# EasyEDA Pro project ProPrj_SensUs2026_ParisBioTek_PCBs.epro, board PCB14
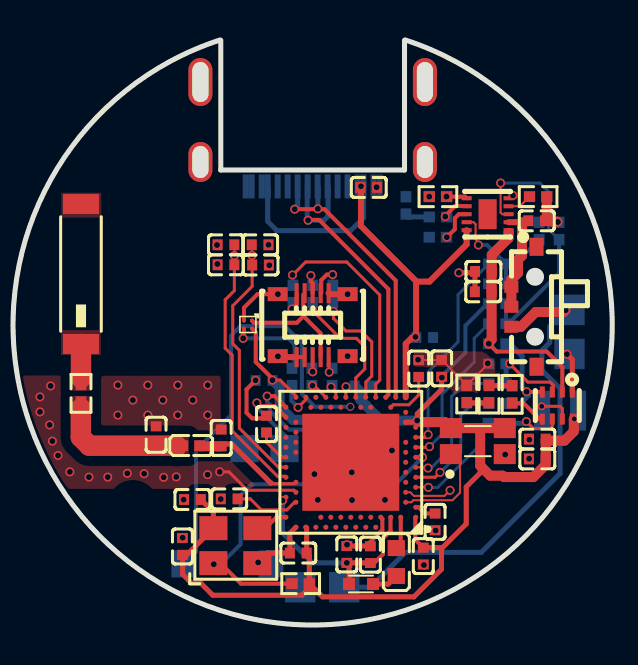
[diagram p2: board, top side]
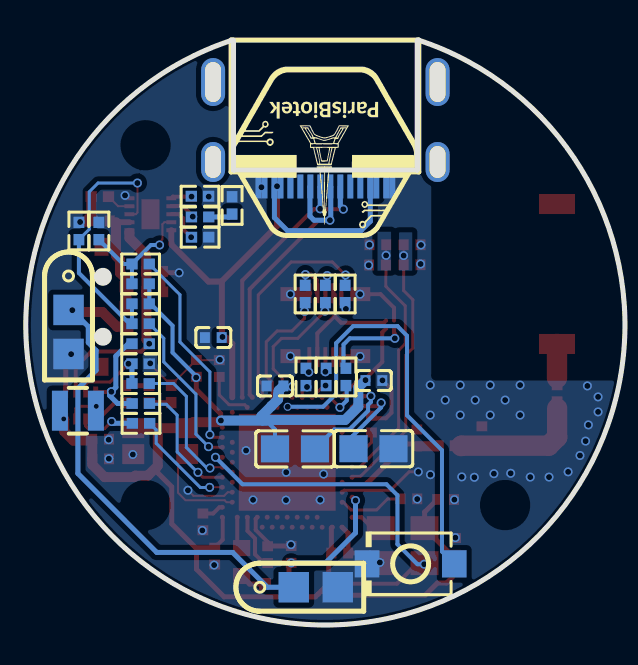
[diagram p3: board, bottom side, seen from below]

Outline 16.22 x 29.27 mm; copper layers: Top Layer, Bottom Layer. Coordinates in mm from the lower left corner of the outline.
Outline path: 9.27,29.27 arc(4.64,0) 0,29.27
Stack: Top Layer 0.035mm / Dielectric1 1.51mm FR4 er 4.5 / Bottom Layer 0.035mm

## Design rules (mm)
template: Custom Config
spacing copperThickness1oz (default): track to track 0.1, other pairs 0.1 to 0.3
spacing copperThickness2oz: track to track 0.203, other pairs 0.152 to 0.3
track width copperThickness1oz (default): min 0.09, default 0.254, max 2.54
track width copperThickness2oz: min 0.203, default 0.254, max 2.54
differential pair differentialPair (default): width min 0.127, default 0.254, max 2.54; gap min 0.152, default 0.152
via viaSize (default): diameter min 0.2, default 0.4, max 10; hole min 0.1, default 0.25, max 6.3
pour e2495 uses copper_imp

## Placement (name value [footprint] x y rotation side)
C1  4.7uF  [C0402]  9.95 12.83 90 top
C2  4.7uF  [C0402]  10.25 14.38 0 bottom
C3  4.7uF  [C0402]  11.1 12.84 90 top
C5  100nF  [C0402]  10.77 5.16 270 top
C8  1nF  [C0402]  2.33 10.05 90 top
C9  100pF  [C0402]  0.46 6.31 180 top
C10  1uF  [C0402]  6.35 3.53 270 top
C11  100nF  [C0402]  7.53 3.52 90 top
C12  100nF  [C0402]  -1.88 3.93 270 top
C13  4.7uF  [C0402]  -1.38 6.28 0 top
C14  100pF  [C0402]  2.01 19.02 0 top
C15  22pF  [C0402]  2.03 18.01 0 top
C16  100pF  [C0402]  0.3 19.02 180 top
C17  22pF  [C0402]  0.3 18.02 180 top
C24  4.7uF  [C0402]  13.19 17.69 0 top
C25  4.7uF  [C0402]  15.89 9.3 0 top
C26  4.7uF  [C0402]  15.89 8.31 0 top
C27  1uF  [C0402]  13.18 16.67 180 top
C28  1uF  [C0402]  15.86 20.22 0 top
C29  1uF  [C0402]  10.18 3.45 270 top
C30  100nF  [C0402]  7.16 11.96 0 bottom
C31  100nF  [C0402]  3.92 3.6 180 top
C32  100nF  [C0402]  2.21 12.23 180 bottom
C33  1uF  [C0402]  7.45 21.89 0 top
C37  0.5pF  [C0402]  -3.2 9.52 90 top
C38  0.8pF  [C0402]  0.06 9.36 270 top
C39  10uF  [C0805]  6.16 8.81 180 bottom
C40  10uF  [C0805]  2.23 8.82 0 bottom
CN1  513389873  [CONN-SMD_513389873]  4.64 15 0 top
L1  10uH  [L0603]  8.83 3.15 90 top
L2  15nH  [IND-SMD_L1.2-W0.6]  7.06 2.05 0 top
L4  2.2uH  [IND-SMD_L2.0-W1.6_MHCHL201610A-1R0M-Q8A]  17.03 10.72 0 bottom
L6  4.7nH  [L0402]  -1.44 8.97 180 top
OSC1  32MHz  [OSC-SMD_4P-L3.2-W2.5-BL]  0.77 3.97 0 top
R1  200kΩ  [R0402]  4.04 2.07 180 top
R2  200kΩ  [R0402]  14.63 11.54 90 top
R3  33kΩ  [R0402]  13.47 11.55 270 top
R4  33kΩ  [R0402]  12.35 11.56 90 top
R7  51kΩ  [R0402]  10.91 20.41 180 bottom
R8  5.1kΩ  [R0402]  9.31 20.99 90 bottom
R9  510Ω  [R0402]  10.91 19.4 180 bottom
R10  10kΩ  [R0402]  10.91 21.43 180 top
R11  0Ω  [R0402]  -6.97 11.59 90 top
R13  0Ω  [R0402]  15.98 19.71 270 bottom
R14  0Ω  [R0402]  16.98 19.71 270 bottom
R15  0Ω  [R0402]  4.6 12.41 90 bottom
R16  0Ω  [R0402]  5.61 12.41 90 bottom
R17  0Ω  [R0402]  5.65 16.56 90 bottom
R18  0Ω  [R0402]  4.64 16.56 90 bottom
R19  0Ω  [R0402]  3.65 16.56 270 bottom
R20  0Ω  [R0402]  3.61 12.41 90 bottom
R21  10kΩ  [R0402]  10.91 21.45 180 bottom
R27  200kΩ  [R0402]  13.89 14.07 0 bottom
R28  200kΩ  [R0402]  15.93 21.43 0 top
R29  200kΩ  [R0402]  13.89 13.07 180 bottom
R30  200kΩ  [R0402]  13.89 17.07 0 bottom
R31  200kΩ  [R0402]  13.89 16.07 0 bottom
R32  0Ω  [R0402]  13.89 12.08 0 bottom
R33  0Ω  [R0402]  13.87 10.09 0 bottom
R34  0Ω  [R0402]  13.89 18.06 0 bottom
R35  0Ω  [R0402]  13.89 15.07 0 bottom
R36  0Ω  [R0402]  13.88 11.08 0 bottom
SW2  TS-1088-AR02016  [SW-SMD_L3.9-W3.0-P4.45]  0.37 3.06 0 bottom
SW3  MK-11C04-G013  [SW-SMD_MK-11C04-G013]  15.22 15.92 90 top
U1  BQ25185DLHR  [WSON-10_L2.2-W2.0-P0.40-BL-EP_TI_DLH0010A]  13.4 20.55 90 top
U5  32.768kHz  [OSC-SMD_4P-L3.2-W1.5-BL]  12.91 9.2 0 top
U7  TPS22916BYFPR  [DSBGA-4_L0.8-W0.8-R2-C2-P0.40-BL]  1.4 15.03 180 top
U9  TPS62840DLCR  [VSON-8_L2.0-W1.5-P0.50-BL]  16.89 10.98 180 top
U10  -  [CSSMR950SH_CONN]  17.5 12.46 180 bottom
U11  2450AT43A100E  [ANT-SMD_L7.0-W2.0-R]  -6.97 17.56 270 top
U12  NRF52840-QIAA-R7  [AQFN-73_L7.0-W7.0-P0.50-BL-EP4.8]  6.55 8.14 90 top
U14  -  [CSSMR950SH_CONN]  2.92 1.89 90 bottom
USB2  TYPE-C-31-M-13  [USB-C-SMD_TYPE-C-31-M-13]  4.64 24.55 0 bottom

## Footprints (pads in the part's own frame, mm; a bottom-side part is the same pattern mirrored in y, then rotated)
ANT-SMD_L7.0-W2.0-R
  rect 1x1.8 smd: 1(3.5,0) 2(-3.5,0)
AQFN-73_L7.0-W7.0-P0.50-BL-EP4.8
  rect 4.85x4.85 smd: 0(0,0)
  round 0.25 smd: A8(-3.25,-1.25) A10(-3.25,-0.75) A12(-3.25,-0.25) A14(-3.25,0.25) A16(-3.25,0.75) A18(-3.25,1.25) A20(-3.25,1.75) A22(-3.25,2.25) A23(-3.25,2.75) AA24(2.25,3.25) AB2(2.5,-2.75) AC5(2.75,-2) AC9(2.75,-1) AC11(2.75,-0.5) AC13(2.75,0) AC15(2.75,0.5) AC17(2.75,1) AC19(2.75,1.5) AC21(2.75,2) AC24(2.75,3.25) AD2(3.25,-2.75) AD4(3.25,-2.25) AD6(3.25,-1.75) AD8(3.25,-1.25) AD10(3.25,-0.75) AD12(3.25,-0.25) AD14(3.25,0.25) AD16(3.25,0.75) AD18(3.25,1.25) AD20(3.25,1.75) AD22(3.25,2.25) AD23(3.25,2.75) B1(-2.75,-3.25) B3(-2.75,-2.5) B5(-2.75,-2) B7(-2.75,-1.5) B9(-2.75,-1) B11(-2.75,-0.5) B13(-2.75,0) B15(-2.75,0.5) B17(-2.75,1) B19(-2.75,1.5) B24(-2.75,3.25) C1(-2.25,-3.25) D2(-2,-2.75) D23(-2,2.75) E24(-1.75,3.25) F2(-1.5,-2.75) F23(-1.5,2.75) G1(-1.25,-3.25) H2(-1,-2.75) H23(-1,2.75) J1(-0.75,-3.25) J24(-0.75,3.25) K2(-0.5,-2.75) L1(-0.25,-3.25) L24(-0.25,3.25) M2(0,-2.75) N1(0.25,-3.25) N24(0.25,3.25) P2(0.5,-2.75) P23(0.5,2.75) R1(0.75,-3.25) R24(0.75,3.25) T2(1,-2.75) T23(1,2.75) U1(1.25,-3.25) U24(1.25,3.25) V23(1.5,2.75) W1(1.75,-3.25) W24(1.75,3.25) Y2(2,-2.75) Y23(2,2.75)
C0402
  rect 0.5x0.54 smd: 1(-0.42,0) 2(0.42,0)
C0805
  rect 1.41x1.35 smd: 1(-1,0) 2(1,0)
CONN-SMD_513389873
  rect 0.2x1 smd: 1(-0.8,-1.6) 2(-0.8,1.6) 3(-0.4,-1.6) 4(-0.4,1.6) 5(-0.001,-1.6) 6(-0.001,1.6) 7(0.4,-1.6) 8(0.4,1.6) 9(0.8,-1.6) 10(0.8,1.6)
  rect 1x0.7 smd: 11(1.75,1.55) 12(1.75,-1.55) 13(-1.75,-1.55) 14(-1.75,1.55)
CSSMR950SH_CONN
  custom 1.524x1.524 smd: 1(0,3.302) 2(0,1.1)
DSBGA-4_L0.8-W0.8-R2-C2-P0.40-BL
  round 0.18 smd: A1(-0.2,-0.2) A2(-0.2,0.2) B1(0.2,-0.2) B2(0.2,0.2)
IND-SMD_L1.2-W0.6
  rect 0.6x0.6 smd: 1(-0.6,0) 2(0.6,0)
IND-SMD_L2.0-W1.6_MHCHL201610A-1R0M-Q8A
  rect 0.8x2 smd: 1(-0.9,0) 2(0.9,0)
L0402
  rect 0.54x0.54 smd: 1(-0.42,0) 2(0.42,0)
L0603
  rect 0.8x0.864 smd: 1(-0.7,0) 2(0.7,0)
OSC-SMD_4P-L3.2-W1.5-BL
  rect 1.1x1 smd: 1(-1.35,-0.65) 2(1.35,-0.65) 3(1.35,0.65) 4(-1.35,0.65)
OSC-SMD_4P-L3.2-W2.5-BL
  rect 1.4x1.2 smd: 1(-1.1,-0.875) 2(1.1,-0.875) 3(1.1,0.875) 4(-1.1,0.875)
R0402
  rect 0.566x0.54 smd: 1(-0.433,0) 2(0.433,0)
SW-SMD_L3.9-W3.0-P4.45
  rect 1.23x1.36 smd: 1(-2.185,0) 2(2.185,0)
SW-SMD_MK-11C04-G013
  rect 0.6x0.7 smd: 1(-1,0.63) 2(1,0.63) C(0,0.63)
  rect 0.9x0.7 smd: 4(3,-0.63) 5(-3,-0.63)
USB-C-SMD_TYPE-C-31-M-13
  oval 1.2x2.4 hole 0.8x2: 0(-5.62,-2.612) 0(5.62,-2.612)
  oval 1.2x2 hole 0.8x1.6: 0(-5.62,1.388) 0(5.62,1.388)
  rect 0.3x1.2 smd: A1(-3.35,2.612) A4(-2.55,2.612) A5(-1.25,2.612) A6(-0.25,2.612) A7(0.25,2.612) A8(1.25,2.612) A9(2.55,2.612) A12(3.35,2.612) B1(3.05,2.612) B4(2.25,2.612) B5(1.75,2.612) B6(0.75,2.612) B7(-0.75,2.612) B8(-1.75,2.612) B9(-2.25,2.612) B12(-3.05,2.612)
VSON-8_L2.0-W1.5-P0.50-BL
  rect 0.25x0.55 smd: 1(-0.75,-0.675) 2(-0.25,-0.675) 3(0.25,-0.675) 4(0.75,-0.675) 5(0.75,0.675) 6(0.25,0.675) 7(-0.25,0.675) 8(-0.75,0.675)
WSON-10_L2.2-W2.0-P0.40-BL-EP_TI_DLH0010A
  rect 0.2x0.5 smd: 1(-0.8,-1.05) 2(-0.4,-1.05) 3(0,-1.05) 4(0.4,-1.05) 5(0.8,-1.05) 6(0.8,1.05) 7(0.4,1.05) 8(0,1.05) 9(-0.4,1.05) 10(-0.8,1.05)
  rect 1.5x0.9 smd: 11(0,0)

## Nets
As in the schematic, except:
GND: C1.2 C2.2 C3.2 C5.2 C8.2 C9.2 C10.1 C11.2 C12.1 C13.1 C14.2 C15.2 C16.2 C17.2 C24.1 C25.1 C26.1 C27.2 C28.2 C29.2 C30.2 C31.2 C32.2 C33.2 C37.2 C38.1 C40.1 CN1.1 CN1.3 CN1.10 CN1.11 CN1.12 CN1.13 CN1.14 OSC1.2 R4.2 R8.2 R9.2 R10.2 R13.1 R14.1 R21.2 R28.2 R29.2 SW2.2 U1.5 U5.2 U7.B1 U9.1 U10.2 U12.0 U12.A23 U12.B7 U12.F2 U12.F23 U14.2 USB2.A1 USB2.A12 USB2.B1 USB2.B12
VIN: C24.2 C27.1 R27.1 U1.1 U9.2
EN_PWR: R27.2 R36.2 U9.4
MODE_PWR: R29.1 R32.2 U9.3
STAT1: R13.2 R30.2 R34.2 U1.9
STAT2: R14.2 R31.2 R35.2 U1.3

Pads without a net: SW3 4 5; U1 11; U11 2; U12 A8 A10 A12 A14 A16 A20 B9 B11 B13 B15 B17 B19 P23 R24 T23 U24 V23 W24 Y23; USB2 0 A8 B8

## Via types
v1: diameter 0.45, hole 0.3, Top Layer to Bottom Layer, 104 vias
v2: diameter 0.4, hole 0.25, Top Layer to Bottom Layer, 2 vias
v3: diameter 0.4, hole 0.3, Top Layer to Bottom Layer, 1 via

## Routing (per net, layer and track width the routed paths; a pad name or vN(x,y) marks a point on that pad's centre or on a via; arc(x,y) is an arc through that point)
GND: length 30.9
  Top Layer w0.1: 12.7,17.62 C24.1 ; 10.47,21.42 R10.2 ; U12.F2 9.52,6.64 9.71,6.46 11.23,6.46 v1(11.52,6.74) ; v1(13.41,13.09) 13.41,13.04 R4.2 12.35,12 C3.2 11.09,13.25 C1.2
  Top Layer w0.15: v1(-0.02,7.66) 0.44,7.66 1.36,6.74 3.69,6.74 U12.F23
  Top Layer w0.2: CN1.3 CN1.1 ; U7.B1 1.2,15.87 1.88,16.55 v1(2.9,16.55) ; U12.B7 8.13,5.31 8.13,4.76 7.53,4.16 C11.2 ; v1(1.78,12.24) 1.33,11.79 1.33,10.62 1.61,10.34 2.2,10.34 C8.2
  Top Layer w0.25: C24.1 12.77,16.68 C27.2 ; C11.2 7.52,3.95 C10.1 ; U9.1 17.64,13.28 v1(17.37,13.55) ; v1(11.96,17.62) 12.7,17.62 ; v1(1.91,3.13) 2.38,3.6 C31.2 3.5,4.59 U12.A23
  Top Layer w0.3: v1(2.9,13.44) 2.94,13.4 CN1.1 ; CN1.10 5.48,16.6 5.53,16.55 v1(6.39,16.55)
  Top Layer w0.5: C28.2 16.36,20.3 16.36,20.47 ; 16.36,20.47 16.65,20.18 16.89,20.18 ; 16.36,20.47 16.36,21.43
  vias: v1(-9.02,11.41) v1(-9.02,10.66) v1(-8.53,10.01) v1(-8.48,11.96) v1(-8.39,9.2) v1(-8.11,8.48) v1(-7.52,7.66) v1(-6.56,7.4) v1(-5.62,7.4) v1(-5.12,12) v1(-5.12,10.5) v1(-4.64,7.59) v1(-4.37,11.25) v1(-3.8,7.57) v1(-3.62,12) v1(-3.62,10.5) v1(-2.87,11.25) v1(-2.82,7.39) v1(-2.12,12) v1(-2.12,10.5) v1(-2.19,7.41) v1(-1.82,6.27) v1(-1.87,4.37) v1(-1.37,11.25) v1(-0.62,12) v1(-0.62,10.5) v1(-0.62,7.52) v1(-0.15,19.01) v1(-0.13,18.06) v1(0.04,6.3) v1(2.43,19.02) v1(2.47,18) v1(4.73,7.55) v1(4.9,6.26) v1(6.36,4.02) v1(6.39,13.45) v1(6.6,7.64) v1(6.61,6.25) v1(7.84,21.9) v1(8.26,6.26) v1(8.61,8.73) v1(9.92,13.27) v1(10.21,3) v1(10.48,21.43) v1(10.8,4.73) v1(14.28,8.53) v1(14.67,21.49) v1(15.49,9.27) v1(15.48,8.32) v1(16.92,20.16)
VBAT: length 5.5
  Top Layer w0.1: 15.12,20.15 15.37,20.15 C28.1
  Top Layer w0.3: U1.2 15.12,20.15
  Top Layer w0.5: 15.12,20.15 15.12,18.47 14.92,18.27 14.92,17.61 14.59,17.28 SW3.2 SW3.C
VBAT_I: length 25.4
  Top Layer w0.5: SW3.1 15.07,14.92 15.81,15.66 17.21,15.66 17.3,15.75
  Bottom Layer w0.25: U14.1 7.54,1.89 9.28,3.63 13.08,3.63 17.03,7.58 17.03,11.83 16.12,12.74 16.12,13.74 16.51,14.13 16.51,14.93 17.34,15.76 U10.1
  vias: v1(17.31,15.75)
VBUS: length 24.6
  Top Layer w0.3: U1.10 12.35,19.04 10.49,17.18 9.83,17.18 ; U12.AD2 9.3,14.07 9.61,14.38 C2.1 9.82,14.39 9.82,17.2 7.06,19.96 v1(7.06,21.95)
  Bottom Layer w0.25: USB2.B9 2.39,20.19 2.85,19.73 6.54,19.73 7.19,20.38 USB2.A9
  vias: v1(9.79,14.41)
VDD: length 71.5
  Top Layer w0.1: 9.79,9.89 9.8,9.89 ; 9.96,10.06 U12.W1
  Top Layer w0.15: U12.AD14 6.3,11.91 v1(6.31,11.92) ; U12.AD23 3.8,11.46 3.01,12.25 v1(2.63,12.25)
  Top Layer w0.2: U12.B1 9.78,5.37 9.78,4.27 C29.1 ; U7.A2 1.79,14.64 1.79,13.16 2.63,12.32 v1(2.63,12.25)
  Top Layer w0.25: C3.1 11.1,11.79 9.88,10.57 9.88,10.32 ; 4.84,1.7 R1.1 4.47,3.47 C31.1 4.34,4.85 U12.A22 ; 4.84,1.7 4.31,1.7 4.1,1.49 -0.36,1.49 -0.97,2.1 -1.43,2.1 -1.87,2.54 -1.87,3.31 OSC1.4 -0.33,5.65 C13.2 ; 4.84,1.7 4.99,1.55 5,1.55 5.13,1.41 9.71,1.41 11.09,2.79 11.09,3.83 ; 9.87,10.15 9.3,10.15 ; C29.1 11.14,3.87 12.33,5.06 12.33,6.91 13.02,7.6 ; 13.03,7.6 13.03,7.97
  Top Layer w0.5: 13.03,9.85 13.03,7.97 13.53,7.47 14.15,7.47 14.22,7.4 15.69,7.4 16.31,8.02 C26.2 C25.2 16.38,9.23 17.25,9.23 17.71,9.69 17.71,10.29 v2(17.74,10.31) ; 13.03,9.85 U5.3 ; 13.03,9.85 U5.4 11.26,10.15 10.03,10.15
  Bottom Layer w0.2: C39.1 7.16,9.78 7.61,10.23 ; v1(11.11,12.38) 11.11,12.45 12.29,13.63 12.29,14.97 13.38,16.07 R31.1 R30.1 ; v1(6.31,11.92) 6.7,11.92 C30.1
  Bottom Layer w0.5: v1(9.87,10.23) 7.77,10.23 ; 7.77,10.23 7.61,10.23 7.58,10.26 3.65,10.26 2.99,10.92 2.99,11.89 v1(2.63,12.25) ; 7.77,10.23 7.84,10.29 7.84,10.45 7.34,10.95 7.34,10.96 7.01,11.29 7.01,11.52 6.98,11.55 6.98,11.72 C30.1
VIN: length 11.4
  Top Layer w0.2: v1(13.46,14.07) 13.85,13.68 16.36,13.68 17.14,12.9 U9.2
  Top Layer w0.5: v1(13.46,14.07) 13.46,14.14 13.6,14.28 C27.1 13.6,17.68 C24.2 13.61,18.52 14.45,19.36 14.45,19.61 14.46,19.62
AD_RESET: length 0.8
  Top Layer w0.1: CN1.9 5.47,13.37 v1(5.47,12.65)
ANT: length 5.6
  Top Layer w0.15: U12.H23 3.72,7.07 2.56,7.07
  Top Layer w0.255: 0.16,8.94 0.27,9.06 0.58,9.06 2.53,7.11 2.56,7.11
  Top Layer w0.5: C38.2 -0.99,8.94 L6.1
CE: length 1.2
  Top Layer w0.1: U1.4 15.01,20.95 R28.1
CRYST_OE: length 18.7
  Top Layer w0.2: U12.N1 10.06,8.39 ; OSC1.1 0.02,3.1 1.04,2.07 R1.2
  Bottom Layer w0.2: v1(-0.31,3.04) 0.03,3.04 1.03,4.04 1.03,6.49 1.58,7.04 8.79,7.04 v1(10.14,8.39)
CS: length 0.9
  Top Layer w0.2: v1(4.55,17.48) 4.55,17.2 4.64,17.11 CN1.6
D+: length 15.2
  Top Layer w0.2: 4.42,20.26 4.97,20.26 8.43,16.8 8.43,11.52 U12.AD6
  Bottom Layer w0.25: USB2.A6 4.37,21.92 4.37,20.29 v1(4.41,20.25) 5.21,20.25 5.41,20.45 5.41,21.92 USB2.B6
D-: length 14.7
  Top Layer w0.2: U12.AD4 8.8,17.23 5.23,20.8 v1(3.74,20.8)
  Bottom Layer w0.25: v1(3.74,20.8) 3.89,20.95 USB2.B7 ; v1(4.9,20.82) 4.9,21.93 USB2.A7
DCC: length 1.6
  Top Layer w0.2: U12.B3 9.05,4.07 L1.2
DEC1: length 1.1
  Top Layer w0.2: U12.C1 9.94,5.89 10.25,5.58 C5.1
DEC3: length 3.3
  Top Layer w0.15: U12.D23 3.73,6.14 3.35,5.76 2.07,5.76 1.52,6.31 C9.1
DEC4: length 10.8
  Top Layer w0.1: 6.46,3 v1(6.35,3.11)
  Top Layer w0.15: v1(3.13,6.23) 3.26,6.36 3.26,6.43
  Top Layer w0.2: U12.B5 8.54,5.38 8.54,4.71 8.16,4.33 8.16,3.54 7.72,3.1 C11.1
  Top Layer w0.25: L2.1 6.46,3 ; C11.1 7.52,3.11 v1(6.35,3.11)
  Bottom Layer w0.25: v1(3.13,6.23) 3.13,4.61 4.63,3.11 v1(6.35,3.11)
DEC5: length 1.8
  Top Layer w0.15: U12.N24 3.07,8.39 2.33,9.14 C8.1
DECUSB: length 2.6
  Top Layer w0.15: U12.AC5 8.67,11.02 9.46,11.02 9.95,11.51 C1.1
EN_PWR: length 5.4
  Top Layer w0.1: 15.36,11.66 v1(15.35,11.67)
  Top Layer w0.2: U9.4 15.36,11.66
  Bottom Layer w0.25: R27.2 14.51,14.07 15.13,13.45 15.13,11.89 v1(15.35,11.67) 15.39,11.67 15.44,11.72 15.44,11.48 15.04,11.08 R36.2
FEED: length 6.4
  Top Layer w1.018: -2.16,8.95 -2.18,8.97 -6.55,8.97 -6.97,9.39 -6.97,10.83
MISO: length 1.9
  Top Layer w0.2: CN1.8 5.07,16.63 5.07,17.25 5.35,17.53 v1(5.64,17.53)
  Bottom Layer w0.1: 5.65,16.99 5.64,17 v1(5.64,17.53)
MODE_PWR: length 4.1
  Top Layer w0.15: U9.3 16.68,11.7 16.68,12 16.52,12.15 15.42,12.15 v1(14.5,13.07)
  Bottom Layer w0.25: R32.2 14.32,12.9 14.49,13.07 v1(14.5,13.07)
MOSI: length 0.7
  Top Layer w0.1: CN1.5 v1(4.64,12.67)
NFC1: length 12.9
  Top Layer w0.1: C15.1 1.61,19 C14.1
  Top Layer w0.15: C15.1 1.61,16.94 0.64,15.97 0.64,14.07 0.97,13.74 0.97,9.85 2.92,7.89 U12.L24
  vias: v1(1.6,18.49)
NFC2: length 13.3
  Top Layer w0.1: C17.1 v1(0.72,18.48) C16.1
  Top Layer w0.15: U12.J24 3.25,7.44 2.88,7.44 0.61,9.71 0.61,13.5 0.26,13.85 0.26,16.27 0.72,16.73 C17.1
NRESET: length 21.7
  Bottom Layer w0.2: SW2.1 -1.2,3.68 -1.2,8.74 0.55,10.49 0.55,14.47 1.03,14.95 ; v3(6.52,10.92) 4.75,10.92 4.1,11.57 4.1,14.1 3.25,14.95 1.03,14.95 ; 1.03,14.95 1.02,14.95
OUT_EN: length 4.4
  Top Layer w0.2: U7.B2 1.2,14.61 1.16,14.57 v1(1.16,14.34)
  Bottom Layer w0.2: v1(1.16,14.34) 3.42,14.34 3.73,14.03 3.73,12.96 R20.2
P0.04: length 6.3
  Top Layer w0.15: v1(11.01,7.64) 10.77,7.39 U12.J1
  Bottom Layer w0.15: R36.1 13.4,11.04 12.6,11.04 12.06,10.5 12.06,8.66 11.03,7.64 v1(11.01,7.64)
P0.06: length 6.9
  Top Layer w0.1: v1(10.41,7.85) 10.37,7.89 U12.L1
  Bottom Layer w0.15: v1(10.41,7.85) 10.57,7.85 11.6,8.88 11.6,11.44 12.24,12.08 R32.1
P0.13: length 11
  Top Layer w0.15: U12.AD8 7.8,12.05 8,12.25 8,16.51 6.35,18.16 4.29,18.16 3.64,17.51 v1(3.63,17.51)
  Bottom Layer w0.1: v1(3.63,17.51) 3.65,17.49 3.65,16.99
P0.15: length 5.7
  Top Layer w0.15: 7.3,11.39 7.3,12.15 7.6,12.45 7.6,14.16 7.05,14.71 6.31,14.71 5.68,15.34 v1(5.68,15.69)
P0.17: length 6
  Top Layer w0.15: v1(4.66,15.7) 6.02,14.34 6.83,14.34 7.25,13.92 7.25,12.81 6.8,12.36 U12.AD12
P0.20: length 0.6
  Top Layer w0.15: v1(5.55,11.91) 5.8,11.67 U12.AD16
P0.22: length 0.9
  Top Layer w0.15: U12.AD18 4.71,11.98 v1(4.63,11.98)
P0.26: length 5.4
  Top Layer w0.1: v1(10.43,6.89) 10.42,6.89 U12.G1
  Bottom Layer w0.15: v1(10.43,6.89) 10.44,6.88 10.9,6.88 13.11,9.09 13.11,9.76 R33.1
P1.00: length 1.9
  Top Layer w0.15: v1(3.91,10.89) 4.3,11.28 U12.AD22
  Bottom Layer w0.2: v1(3.91,10.89) 3.57,11.23 3.57,11.94 R20.1
P1.09: length 8.1
  Top Layer w0.15: v1(10.49,8.92) 10.46,8.89 U12.R1
  Bottom Layer w0.15: v1(10.49,8.92) 11.12,9.55 11.12,11.55 12.73,13.16 12.73,14.34 R35.1
P1.12: length 10.5
  Top Layer w0.1: 10.29,9.39 v1(10.42,9.52)
  Top Layer w0.15: U12.U1 10.29,9.39
  Bottom Layer w0.15: R34.1 11.92,16.52 11.92,14.16 10.42,12.66 v1(10.42,9.52)
SCLK: length 0.9
  Top Layer w0.2: CN1.2 3.84,16.04 v1(3.61,15.81)
STAT1: length 6.5
  Top Layer w0.1: v1(12.94,19.01) 12.94,19.15 12.8,19.29 12.8,20.05 12.7,20.15 U1.9
  Bottom Layer w0.2: R30.2 R34.2 ; R34.2 13.37,19.01 v1(12.94,19.01) ; R34.2 14.76,18.06 R13.2
STAT2: length 13.5
  Top Layer w0.1: U1.3 14.13,20.55 14.05,20.63 v1(14.05,22.11)
  Bottom Layer w0.15: R14.2 16.46,19.8 16.46,21.67 16.02,22.11 v1(14.05,22.11)
  Bottom Layer w0.2: R31.2 R35.2 14.44,15.07 16.98,17.61 R14.2
STOP_PWR: length 2.9
  Top Layer w0.15: U9.6 16.64,9.95 16.52,9.83 15.69,9.83 v1(15.34,10.18)
  Bottom Layer w0.25: 14.3,10.09 15.25,10.09 v1(15.34,10.18)
SWDCLK: length 4.7
  Top Layer w0.2: U12.AA24 2.74,10.95 2,10.95 v1(1.84,11.11)
  Bottom Layer w0.2: C40.2 3.29,8.88 3.29,9.44 1.84,10.88 v1(1.84,11.11)
SWDIO: length 5.4
  Top Layer w0.2: U12.AC24 2.74,11.45 v1(2.36,11.45)
  Bottom Layer w0.2: C39.2 4.19,9.78 3.43,9.78 2.5,10.72 2.5,11.01 2.36,11.15 v1(2.36,11.45)
VOUT1: length 6.3
  Top Layer w0.1: CN1.4 4.17,16.53
  Top Layer w0.2: CN1.7 5.04,14.59 4.18,15.45 3.85,15.12 1.71,15.12 U7.A1 ; 4.17,16.53 4.17,15.46
XC1: length 1.7
  Top Layer w0.2: OSC1.3 2.27,4.85 2.82,5.39 U12.B24
XL1: length 5
  Top Layer w0.1: U12.D2 9.58,6.14 9.68,6.24 11.64,6.24 12.02,6.62 12.02,8.09 U5.1
$1N3350: length 1.3
  Top Layer w0.25: L1.1 8.43,2.05 L2.2
$1N6090: length 1.8
  Top Layer w0.2: U9.5 15.99,10.31 15.19,11.11 R2.1
$1N6166: length 1.2
  Top Layer w0.254: R3.1 13.48,11.97 14.63,11.97
$1N6242: length 1.1
  Top Layer w0.254: R3.2 12.36,11.12 R4.1
$1N6296: length 1.6
  Top Layer w0.15: U9.7 17.14,10.83 17.03,10.94 v2(16.11,10.94)
$1N6953: length 1.3
  Top Layer w0.2: v1(11.28,20.43) 11.28,20.47 11.77,20.96 12.34,20.96 U1.7
$1N7034: length 1.2
  Bottom Layer w0.25: R7.2 9.45,20.41 R8.1
$1N7110: length 1.8
  Top Layer w0.2: v1(11.36,19.4) 11.76,19.8 11.76,20.35 11.96,20.55 U1.8
$1N7200: length 1
  Top Layer w0.2: U1.6 12.27,21.43 R10.1
  vias: v1(11.34,21.43)
$1N13722: length 1.7
  Top Layer w1.018: U11.1 -6.97,12.35

## Copper pours and planes (outline as drawn; the poured copper is in the pictures)
GND on Top Layer: -5.82,12.47 0.28,12.47 0.73,12.02 0.73,9.23 2.69,7.27 3.98,7.27 3.98,6.52 3.99,6.51 3.86,6.38 1.89,6.38 1.63,6.64 1.3,6.64 1.13,6.81 -7.56,6.81 -10.32,9.57 -10.32,12.48 -5.83,12.48
GND on Top Layer: 9.44,13.71 12.43,13.71 12.46,13.68 13.25,13.68 13.78,13.15 13.78,12.53 13.7,12.45 13.22,12.45 13,12.23 13,11.61 12.94,11.55 11.78,11.55 11.47,11.86 11.47,12.74 11.32,12.89 9.48,12.89 9.44,12.93
GND on Bottom Layer: 25.31,16.27 25.27,17.18 25.19,18.1 25.07,19 24.92,19.9 24.72,20.8 24.48,21.68 24.21,22.56 23.89,23.42 23.54,24.26 23.15,25.09 22.73,25.91 22.27,26.7 21.78,27.47 21.26,28.22 20.7,28.95 20.11,29.65 19.49,30.32 18.84,30.97 18.17,31.59 17.47,32.18 16.74,32.74 15.99,33.26 15.22,33.75 14.43,34.21 13.61,34.63 12.78,35.02 11.94,35.37 11.08,35.69 10.2,35.96 9.32,36.2 8.42,36.4 7.52,36.55 6.62,36.67 5.7,36.75 4.79,36.79 3.87,36.79 2.96,36.75 2.05,36.67 1.14,36.55 0.24,36.4 -0.66,36.2 -1.54,35.96 -2.42,35.69 -3.28,35.37 -4.12,35.02 -4.95,34.63 -5.77,34.21 -6.56,33.75 -7.33,33.26 -8.08,32.74 -8.81,32.18 -9.51,31.59 -10.18,30.97 -10.83,30.32 -11.45,29.65 -12.04,28.95 -12.6,28.22 -13.12,27.47 -13.61,26.7 -14.07,25.91 -14.49,25.09 -14.88,24.26 -15.23,23.42 -15.54,22.56 -15.82,21.68 -16.06,20.8 -16.26,19.9 -16.41,19 -16.53,18.1 -16.61,17.18 -16.65,16.27 -16.65,15.35 -16.61,14.44 -16.53,13.53 -16.41,12.62 -16.26,11.72 -16.06,10.82 -15.82,9.94 -15.54,9.06 -15.23,8.2 -14.88,7.36 -14.49,6.53 -14.07,5.71 -13.61,4.92 -13.12,4.15 -12.6,3.4 -12.04,2.67 -11.45,1.97 -10.83,1.3 -10.18,0.65 -9.51,0.03 -8.81,-0.56 -8.08,-1.12 -7.33,-1.64 -6.56,-2.13 -5.77,-2.59 -4.95,-3.01 -4.12,-3.4 -3.28,-3.75 -2.42,-4.06 -1.54,-4.34 -0.66,-4.58 0.24,-4.78 1.14,-4.93 2.05,-5.05 2.96,-5.13 3.87,-5.17 4.79,-5.17 5.7,-5.13 6.62,-5.05 7.52,-4.93 8.42,-4.78 9.32,-4.58 10.2,-4.34 11.08,-4.06 11.94,-3.75 12.78,-3.4 13.61,-3.01 14.43,-2.59 15.22,-2.13 15.99,-1.64 16.74,-1.12 17.47,-0.56 18.17,0.03 18.84,0.65 19.49,1.3 20.11,1.97 20.7,2.67 21.26,3.4 21.78,4.15 22.27,4.92 22.73,5.71 23.15,6.53 23.54,7.36 23.89,8.2 24.21,9.06 24.48,9.94 24.72,10.82 24.92,11.72 25.07,12.62 25.19,13.53 25.27,14.44 25.31,15.35
(no net) on Top Layer: -7.95,21.62 -5.95,21.62 -5.95,20.37 -7.95,20.37
FEED on Top Layer: -7.47,11.46 -6.46,11.46 -6.46,10.45 -7.47,10.45
NFC1 on Bottom Layer: 1.35,19.67 2.03,19.67 2.03,17.73 1.35,17.73
NFC2 on Bottom Layer: 0.29,19.64 0.95,19.64 0.95,17.73 0.29,17.73
NONE on Bottom Layer: -10.38,22.01 -0.95,22.01 -0.92,21.98 -0.92,12.5 -0.91,12.49 -10.34,12.49 -10.38,12.53
$1N13722 on Top Layer: -7.47,12.73 -6.46,12.73 -6.46,11.72 -7.47,11.72
$1N13722 on Top Layer: -7.97,14.76 -5.97,14.76 -5.97,13.51 -7.97,13.51

Small or netless copper shapes (teardrops, artwork), in the pictures only: 1 on Top Layer
